# Altium schematic sheet USB-UART Section.SchDoc
size A4
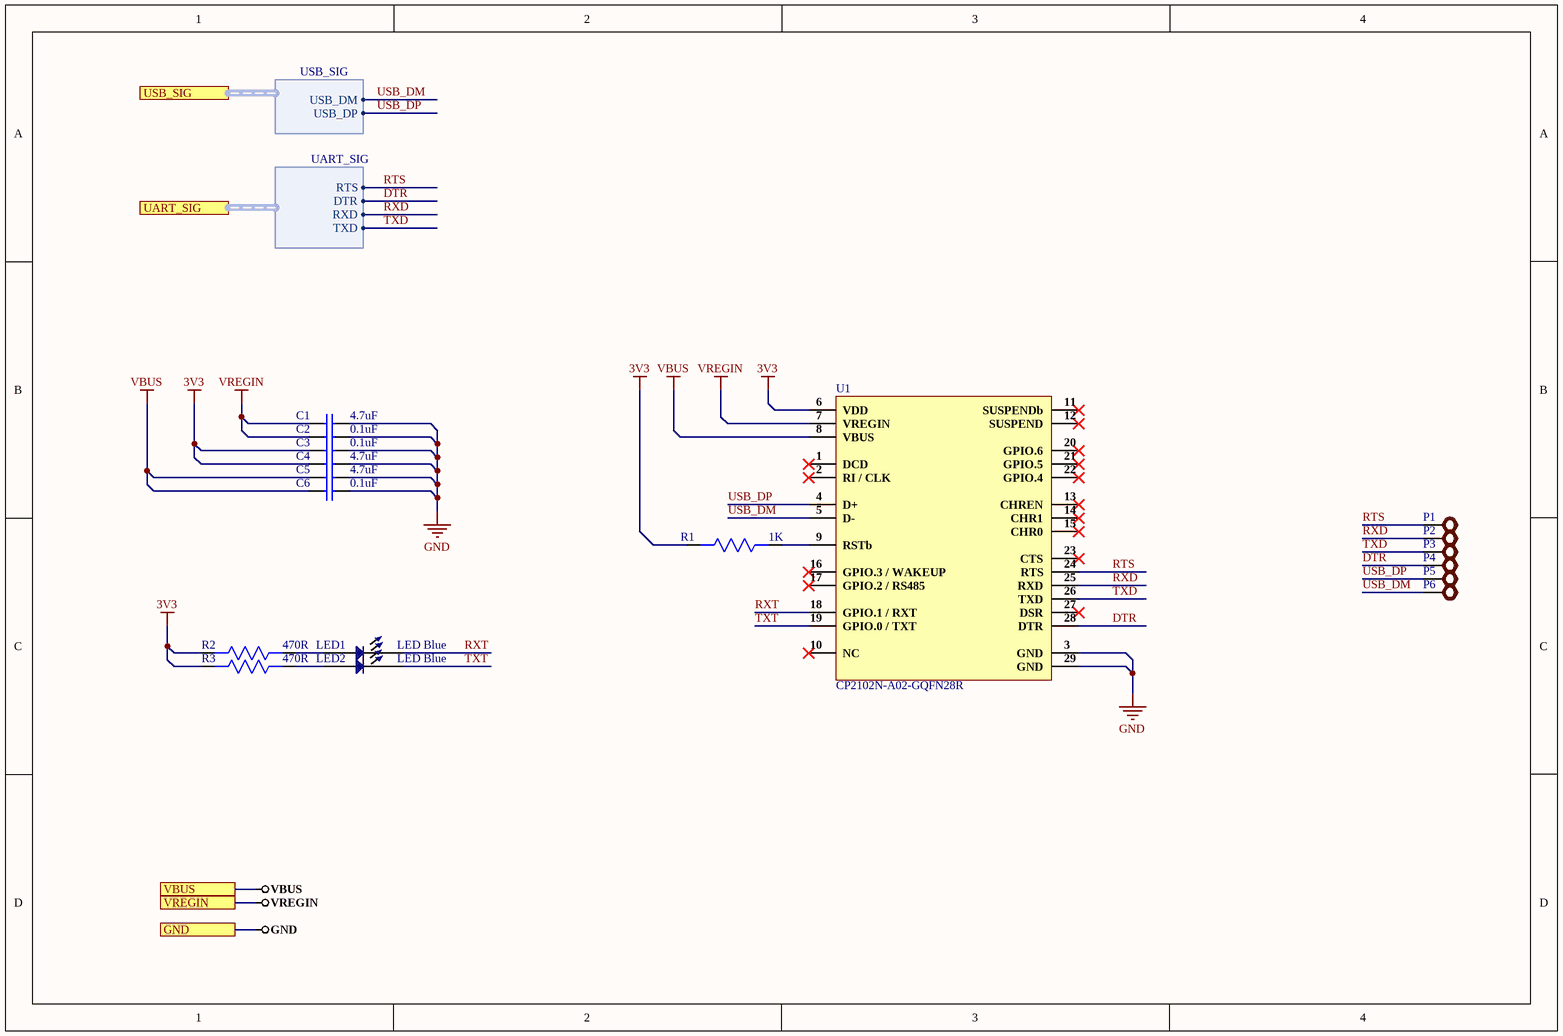
[diagram p0: USB-UART Section.SchDoc]

## Parts
C1  4.7uF  [Cap0603]
C2  0.1uF  [CAP 0201]
C3  0.1uF  [CAP 0201]
C4  4.7uF  [Cap0603]
C5  4.7uF  [Cap0603]
C6  0.1uF  [CAP 0201]
LED1  LED Blue  [LED 0402]
LED2  LED Blue  [LED 0402]
P1  Test Point  [TEST POINT]  (value not drawn)
P2  Test Point  [TEST POINT]  (value not drawn)
P3  Test Point  [TEST POINT]  (value not drawn)
P4  Test Point  [TEST POINT]  (value not drawn)
P5  Test Point  [TEST POINT]  (value not drawn)
P6  Test Point  [TEST POINT]  (value not drawn)
R1  1K  [Res-0201]
R2  470R  [Res-0201]
R3  470R  [Res-0201]
U1  CP2102N-A02-GQFN28R  [28-QFN (5x5)]

## Ports
GND, UART_SIG (harness UART_SIG), USB_SIG (harness USB_SIG), VBUS, VREGIN

## Harnesses
USB_SIG: USB_DM, USB_DP
UART_SIG: RXD, TXD, RTS, DTR

## Nets
3V3: C3.1 C4.1 R1.2 R2.2 R3.2 U1.6(VDD)
GND: C1.2 C2.2 C3.2 C4.2 C5.2 C6.2 U1.3(GND) U1.29(GND) ; port GND
VBUS: C5.1 C6.1 U1.8(VBUS) ; port VBUS
VREGIN: C1.1 C2.1 U1.7(VREGIN) ; port VREGIN
DTR: P4.1 U1.28(DTR) ; port UART_SIG.DTR
RTS: P1.1 U1.24(RTS) ; port UART_SIG.RTS
RXD: P2.1 U1.25(RXD) ; port UART_SIG.RXD
RXT: LED1.2 U1.18(GPIO.1_/_RXT)
TXD: P3.1 U1.26(TXD) ; port UART_SIG.TXD
TXT: LED2.2 U1.19(GPIO.0_/_TXT)
USB_DM: P6.1 U1.5(D-) ; port USB_SIG.USB_DM
USB_DP: P5.1 U1.4(D+) ; port USB_SIG.USB_DP
NetLED1_1: LED1.1 R2.1
NetLED2_1: LED2.1 R3.1
NetR1_1: R1.1 U1.9(RSTb)

Not connected (* = marked no-connect by the designer): U1 1(DCD)* 2(RI_/_CLK)* 10(NC)* 11(SUSPENDb)* 12(SUSPEND)* 13(CHREN)* 14(CHR1)* 15(CHR0)* 16(GPIO.3_/_WAKEUP)* 17(GPIO.2_/_RS485)* 20(GPIO.6)* 21(GPIO.5)* 22(GPIO.4)* 23(CTS)* 27(DSR)*

## Library data of the parts
C1 C4 C5 = C1608X5R1E475M080AC: CAP CER 4.7UF 25V X5R 0603; Manufacturer: TDK; Dielectric Material: Ceramic; Tolerance: 20%; ComponentLink1URL: http://www.yageo.com/NewPortal/_en/search/productDocs.jsp?YageoPartNumber=AC0603JRNPO0BN470&src-supplier=Digi-Key; ComponentLink1Description: http://www.yageo.com/NewPortal/_en/search/productDocs.jsp?YageoPartNumber=AC0603JRNPO0BN470&src-supplier=Digi-Key; Supplier 1: Mouser; Manufacturer Part Number: C1608X5R1E475M080AC; Stock 1: 40236; Pricing 1: 1=0.29, 10=0.237, 100=0.142, 500=0.106, 1000=0.09, 4000=0.076, 8000=0.072, 24000=0.07, 48000=0.067 (USD); Mount: Surface Mount; Case/Package: 0603; Weight: 7.1E-05oz; Case Code (Metric): 1608; Case Code (Imperial): 0603; Min Operating Temperature: -55°C; Max Operating Temperature: 85°C; Voltage Rating (DC): 25V; Packaging: Tape and Reel; Package Quantity: 1; Capacitance: 4.7uF; Voltage Rating: 25V; Dielectric: X5R; Termination: SMD/SMT; Composition: Ceramic; Length: 1.6mm; Height: 0.8mm; Width: 0.031inch; Thickness: 0.039inch; Depth: 0.8mm; Radiation Hardening: No; REACH SVHC: No SVHC; Lead Free: Lead Free; ComponentLink2URL: https://www.verical.com/server-webapp/html/getDatasheet?partID=726745&src-supplier=Verical; ComponentLink2Description: https://www.verical.com/server-webapp/html/getDatasheet?partID=726745&src-supplier=Verical; Supplier Part Number 1: 810-C1608X5R1E475M
C2 C3 C6 = GRM033C81E104KE14D: CAP CER 0.1UF 25V X6S 0201; Manufacturer: Murata; Capacitance: 100nF; Tolerance: 10%; Supplier 1: Digi-Key; Manufacturer Part Number: GRM033C81E104KE14D; RoHS: Yes; Category: Ceramic Capacitors; Stock 1: 91; Pricing 1: 1=0.10000, 10=0.05100, 50=0.02780, 100=0.02260, 500=0.01616, 1000=0.01270, 2500=0.01155, 5000=0.01063 (USD); Mount: Surface Mount; Case/Package: 0201; Case Code (Metric): 0603; Case Code (Imperial): 0201; Weight: 1.2E-05oz; Min Operating Temperature: -55°C; Max Operating Temperature: 105°C; Packaging: Tape and Reel; Voltage Rating: 25V; Dielectric: X6S; Termination: SMD/SMT; Voltage Rating (DC): 25V; Package Quantity: 15000; Length: 0.024inch; Width: 0.3mm; Height: 0.3mm; Thickness: 0.013inch; RoHS Compliant: Yes; ComponentLink1URL: http://www.mouser.com/ds/2/281/c02e-2905.pdf?src-supplier=Mouser; ComponentLink1Description: http://www.mouser.com/ds/2/281/c02e-2905.pdf?src-supplier=Mouser; ComponentLink2URL: http://www.farnell.com/datasheets/2722733.pdf?src-supplier=Farnell; ComponentLink2Description: http://www.farnell.com/datasheets/2722733.pdf?src-supplier=Farnell; ComponentLink3URL: http://search.murata.co.jp/Ceramy/image/img/A01X/G101/ENG/GRM033C81E104KE14-01.pdf?src-supplier=Digi-Key; ComponentLink3Description: http://search.murata.co.jp/Ceramy/image/img/A01X/G101/ENG/GRM033C81E104KE14-01.pdf?src-supplier=Digi-Key; Supplier Part Number 1: 490-10403-1-ND
LED1 LED2 = APHHS1005QBC/D: LED BLUE CLEAR CHIP SMD 0402; Manufacturer: Kingbright; Lens Colour: Colorless; Forward Current: 20mA; Forward Voltage: 3.3V; Power Rating: 120mW; Luminous Intensity: 60mcd; Viewing Angle: 120°; Dominant Wavelength: 465nm; Supplier 1: Digi-Key; Manufacturer Part Number: APHHS1005QBC/D; Stock 1: 57149; Pricing 1: 1=0.58, 10=0.42, 25=0.3432, 100=0.2746, 250=0.23168, 500=0.19734, 1000=0.15444 (USD); Mount: Surface Mount; Case/Package: 0402; Colour: Blue; Case Code (Metric): 1005; Case Code (Imperial): 0402; Min Operating Temperature: -40°C; Max Operating Temperature: 85°C; Package Quantity: 2000; Illumination Colour: Blue; Packaging: Tape and Reel; Lens Style: Clear; Lens Transparency: Clear; Test Current: 20mA; Length: 1mm; Height: 0.6mm; Width: 0.5mm; Lead Free: Lead Free; ComponentLink1URL: http://www.mouser.com/ds/2/216/APHHS1005QBC-D-54846.pdf; ComponentLink1Description: http://www.mouser.com/ds/2/216/APHHS1005QBC-D-54846.pdf; ComponentLink2URL: http://www.kingbrightusa.com/images/catalog/SPEC/APHHS1005QBC-D.pdf; ComponentLink2Description: http://www.kingbrightusa.com/images/catalog/SPEC/APHHS1005QBC-D.pdf; Supplier Part Number 1: 754-1504-1-ND
P1-P6 = TEST POINT: Test Point ON
R1 = RC0201FR-071KP: RES 1K OHM 1% 1/20W 0201; Manufacturer: Yageo; Supplier 1: Digi-Key; Manufacturer Part Number: RC0201FR-071KP; RoHS: Yes; Stock 1: 4800; Pricing 1: 1=0.11000, 10=0.10200, 100=0.03940, 1000=0.01734, 2500=0.01497, 5000=0.01340 (USD); RoHS Compliant: Yes; Supplier Part Number 1: 13-RC0201FR-071KPCT-ND
R2 R3 = RC0201JR-07470RL: RES SMD 470 OHM 5% 1/20W 0201; Manufacturer: Yageo; Temperature Coefficient: 200ppm/°C; Power Rating: 50mW; Voltage Rating: 25V; Supplier 1: Digi-Key; Manufacturer Part Number: RC0201JR-07470RL; Stock 1: 101994; Pricing 1: 1=0.1, 10=0.028, 100=0.0115, 1000=0.00517, 2500=0.00448, 5000=0.00371 (USD); Case/Package: 0201; Number of Pins: 2; Contact Plating: Tin,Matte; Case Code (Metric): 0603; Case Code (Imperial): 0201; Min Operating Temperature: -55°C; Max Operating Temperature: 125°C; Tolerance: 5%; Resistance: 470R; Composition: Thick Film; Package Quantity: 1; Packaging: Tape and Reel; Number of Terminations: 2; Termination: SMD/SMT; Military Standard: Not; Max Power Dissipation: 50mW; Voltage Rating (DC): 25V; Features: Moisture Resistant; Length: 0.6mm; Height: 0.01inch; Width: 0.3mm; Depth: 0.3mm; Radiation Hardening: No; REACH SVHC: No SVHC; Lead Free: Lead Free; ComponentLink1URL: http://www.farnell.com/datasheets/443682.pdf?src-supplier=Farnell; ComponentLink1Description: http://www.farnell.com/datasheets/443682.pdf?src-supplier=Farnell; ComponentLink2URL: http://www.yageo.com/documents/recent/PYu-RC0201_51_RoHS_L_8.pdf?src-supplier=Avnet; ComponentLink2Description: http://www.yageo.com/documents/recent/PYu-RC0201_51_RoHS_L_8.pdf?src-supplier=Avnet; ComponentLink3URL: http://www.yageo.com/documents/recent/PYu-RC_Group_51_RoHS_L_9.pdf?src-supplier=Digi-Key; ComponentLink3Description: http://www.yageo.com/documents/recent/PYu-RC_Group_51_RoHS_L_9.pdf?src-supplier=Digi-Key; ComponentLink4URL: http://www.yageo.com/documents/recent/PYu-RC_Group_51_RoHS_L_10.pdf?src-supplier=Digi-Key; ComponentLink4Description: http://www.yageo.com/documents/recent/PYu-RC_Group_51_RoHS_L_10.pdf?src-supplier=Digi-Key; ComponentLink5URL: http://www.yageo.com.tw/exep/pages/download/literatures/PYu-R_INT-thick_7.pdf?src-supplier=Digi-Key; ComponentLink5Description: http://www.yageo.com.tw/exep/pages/download/literatures/PYu-R_INT-thick_7.pdf?src-supplier=Digi-Key; ComponentLink6URL: http://www.yageo.com/documents/recent/PYu-RC0201_51_RoHS_L_8.pdf?src-supplier=Avnet+Europe; ComponentLink6Description: http://www.yageo.com/documents/recent/PYu-RC0201_51_RoHS_L_8.pdf?src-supplier=Avnet+Europe; Supplier Part Number 1: 311-470NCT-ND
U1 = CP2102N-A02-GQFN28R: IC USB TO UART BRIDGE QFN28; Manufacturer: Silicon Labs; Supplier 1: Digi-Key; Manufacturer Part Number: CP2102N-A02-GQFN28R; RoHS: Yes; Stock 1: 1242; Pricing 1: 1=1.47000 (USD); Supplier Part Number 1: 336-5890-1-ND